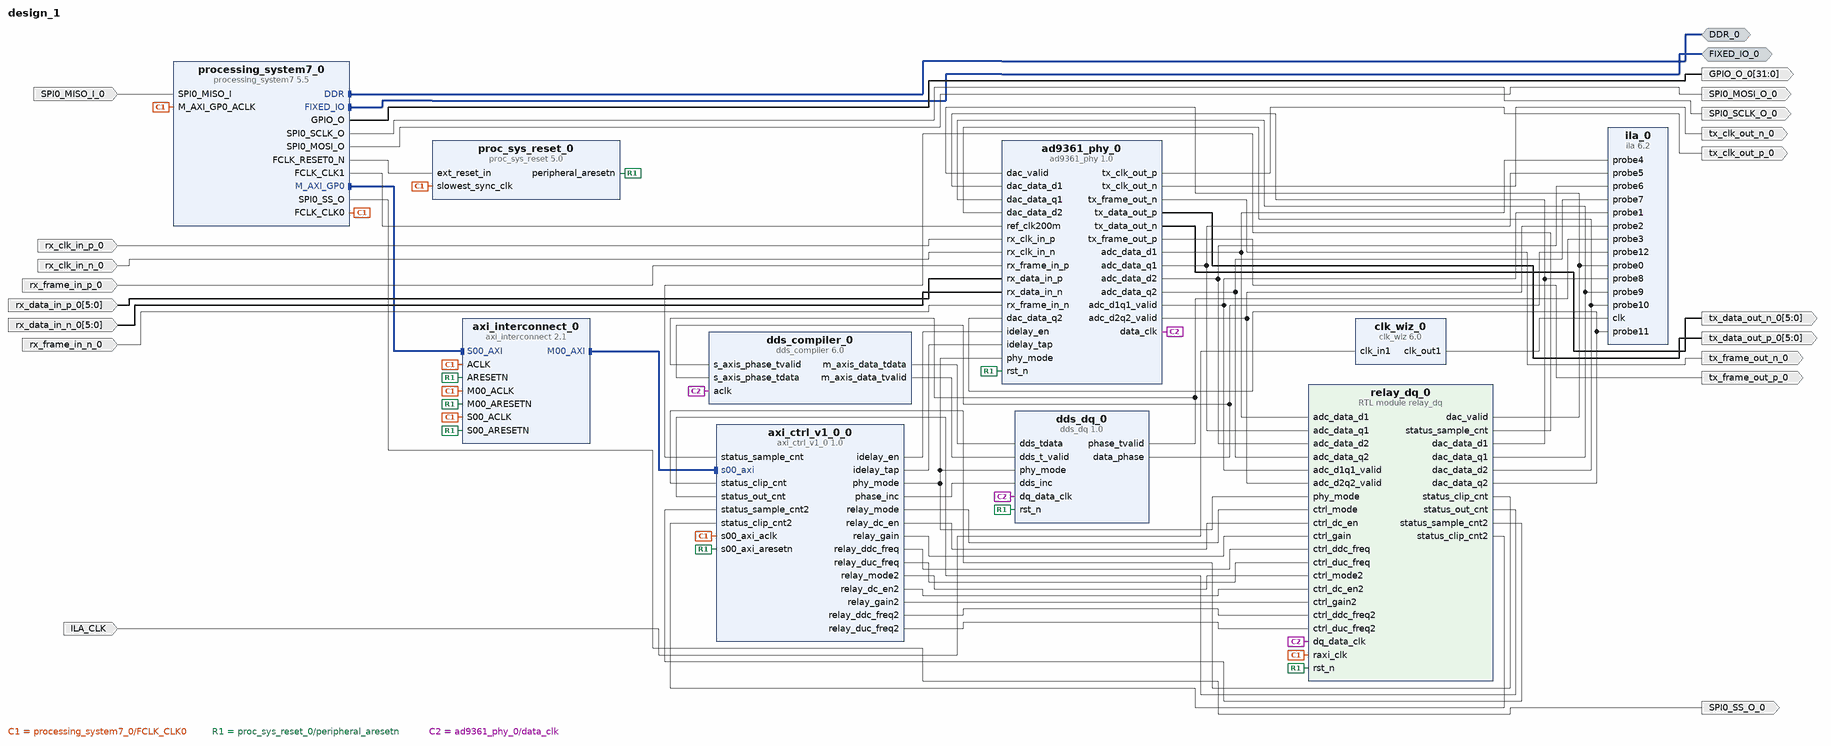
[diagram p0: block diagram of the top level]
# Vivado block design design_1, xc7z010clg400-1, Vivado 2018.3
create_bd_design design_1

create_bd_intf_port -mode Master -vlnv xilinx.com:display_processing_system7:fixedio_rtl:1.0 FIXED_IO_0
create_bd_intf_port -mode Master -vlnv xilinx.com:interface:ddrx_rtl:1.0 DDR_0
create_bd_port -dir O -from 31 -to 0 GPIO_O_0
create_bd_port -dir O SPI0_SCLK_O_0
create_bd_port -dir O SPI0_MOSI_O_0
create_bd_port -dir I SPI0_MISO_I_0
create_bd_port -dir O SPI0_SS_O_0
create_bd_port -dir I rx_clk_in_p_0
create_bd_port -dir I rx_clk_in_n_0
create_bd_port -dir I rx_frame_in_p_0
create_bd_port -dir I -from 5 -to 0 rx_data_in_p_0
create_bd_port -dir I -from 5 -to 0 rx_data_in_n_0
create_bd_port -dir I rx_frame_in_n_0
create_bd_port -dir O -from 5 -to 0 tx_data_out_p_0
create_bd_port -dir O tx_clk_out_p_0
create_bd_port -dir O tx_clk_out_n_0
create_bd_port -dir O tx_frame_out_n_0
create_bd_port -dir O -from 5 -to 0 tx_data_out_n_0
create_bd_port -dir O tx_frame_out_p_0
create_bd_port -dir I -type clk ILA_CLK
set_property -dict {CONFIG.FREQ_HZ 40000000} [get_bd_ports ILA_CLK]

create_bd_cell -type ip -vlnv xilinx.com:user:ad9361_phy:1.0 ad9361_phy_0
create_bd_cell -type ip -vlnv xilinx.com:user:axi_ctrl_v1_0:1.0 axi_ctrl_v1_0_0
create_bd_cell -type ip -vlnv xilinx.com:ip:axi_interconnect:2.1 axi_interconnect_0
set_property -dict {CONFIG.NUM_MI 1} [get_bd_cells axi_interconnect_0]
create_bd_cell -type ip -vlnv xilinx.com:ip:dds_compiler:6.0 dds_compiler_0
set_property -dict [list \
  CONFIG.DATA_Has_TLAST Not_Required \
  CONFIG.Has_Phase_Out false \
  CONFIG.Latency 6 \
  CONFIG.M_DATA_Has_TUSER Not_Required \
  CONFIG.Noise_Shaping None \
  CONFIG.Output_Frequency1 0 \
  CONFIG.Output_Width 12 \
  CONFIG.PINC1 0 \
  CONFIG.Parameter_Entry Hardware_Parameters \
  CONFIG.PartsPresent SIN_COS_LUT_only \
  CONFIG.Phase_Width 12 \
  CONFIG.S_PHASE_Has_TUSER Not_Required \
] [get_bd_cells dds_compiler_0]
create_bd_cell -type ip -vlnv xilinx.com:user:dds_dq:1.0 dds_dq_0
create_bd_cell -type ip -vlnv xilinx.com:ip:ila:6.2 ila_0
set_property -dict [list \
  CONFIG.C_ENABLE_ILA_AXI_MON false \
  CONFIG.C_MONITOR_TYPE Native \
  CONFIG.C_NUM_OF_PROBES 13 \
  CONFIG.C_PROBE10_WIDTH 12 \
  CONFIG.C_PROBE11_WIDTH 12 \
  CONFIG.C_PROBE12_WIDTH 12 \
  CONFIG.C_PROBE3_WIDTH 1 \
  CONFIG.C_PROBE4_WIDTH 12 \
  CONFIG.C_PROBE5_WIDTH 12 \
  CONFIG.C_PROBE6_WIDTH 12 \
  CONFIG.C_PROBE7_WIDTH 12 \
  CONFIG.C_PROBE8_WIDTH 12 \
  CONFIG.C_PROBE9_WIDTH 12 \
] [get_bd_cells ila_0]
create_bd_cell -type ip -vlnv xilinx.com:ip:proc_sys_reset:5.0 proc_sys_reset_0
create_bd_cell -type ip -vlnv xilinx.com:ip:processing_system7:5.5 processing_system7_0
set_property -dict [list \
  CONFIG.PCW_APU_PERIPHERAL_FREQMHZ 766 \
  CONFIG.PCW_ENET0_PERIPHERAL_ENABLE 0 \
  CONFIG.PCW_EN_CLK1_PORT 1 \
  CONFIG.PCW_FCLK_CLK1_BUF TRUE \
  CONFIG.PCW_FPGA0_PERIPHERAL_FREQMHZ 100 \
  CONFIG.PCW_FPGA1_PERIPHERAL_FREQMHZ 200 \
  CONFIG.PCW_FPGA_FCLK1_ENABLE 1 \
  CONFIG.PCW_GPIO_EMIO_GPIO_ENABLE 1 \
  CONFIG.PCW_GPIO_EMIO_GPIO_IO 32 \
  CONFIG.PCW_GPIO_EMIO_GPIO_WIDTH 32 \
  CONFIG.PCW_GPIO_MIO_GPIO_ENABLE 0 \
  CONFIG.PCW_PERIPHERAL_BOARD_PRESET None \
  CONFIG.PCW_PRESET_BANK1_VOLTAGE {LVCMOS 1.8V} \
  CONFIG.PCW_QSPI_PERIPHERAL_ENABLE 0 \
  CONFIG.PCW_SD0_GRP_CD_ENABLE 0 \
  CONFIG.PCW_SD0_GRP_WP_ENABLE 0 \
  CONFIG.PCW_SD0_PERIPHERAL_ENABLE 1 \
  CONFIG.PCW_SD0_SD0_IO {MIO 40 .. 45} \
  CONFIG.PCW_SDIO_PERIPHERAL_FREQMHZ 50 \
  CONFIG.PCW_SPI0_PERIPHERAL_ENABLE 1 \
  CONFIG.PCW_SPI0_SPI0_IO EMIO \
  CONFIG.PCW_UART1_PERIPHERAL_ENABLE 1 \
  CONFIG.PCW_UART1_UART1_IO {MIO 48 .. 49} \
  CONFIG.PCW_UART_PERIPHERAL_FREQMHZ 100 \
  CONFIG.PCW_UIPARAM_DDR_BUS_WIDTH {16 Bit} \
  CONFIG.PCW_UIPARAM_DDR_FREQ_MHZ 533.333333 \
  CONFIG.PCW_UIPARAM_DDR_PARTNO {MT41K256M16 RE-125} \
  CONFIG.PCW_USB0_PERIPHERAL_ENABLE 0 \
] [get_bd_cells processing_system7_0]
# 365 more settings of processing_system7_0 are not shown: defaults, MIO pin electricals, DDR timing, and values the tool derives
create_bd_cell -type ip -vlnv xilinx.com:ip:clk_wiz:6.0 clk_wiz_0
set_property -dict [list \
  CONFIG.CLKIN1_JITTER_PS 250.0 \
  CONFIG.CLKOUT1_DRIVES BUFG \
  CONFIG.CLKOUT1_JITTER 180.876 \
  CONFIG.CLKOUT1_PHASE_ERROR 191.950 \
  CONFIG.CLKOUT2_DRIVES BUFG \
  CONFIG.CLKOUT3_DRIVES BUFG \
  CONFIG.CLKOUT4_DRIVES BUFG \
  CONFIG.CLKOUT5_DRIVES BUFG \
  CONFIG.CLKOUT6_DRIVES BUFG \
  CONFIG.CLKOUT7_DRIVES BUFG \
  CONFIG.FEEDBACK_SOURCE FDBK_AUTO \
  CONFIG.MMCM_CLKFBOUT_MULT_F 25.000 \
  CONFIG.MMCM_CLKIN1_PERIOD 25.000 \
  CONFIG.MMCM_CLKIN2_PERIOD 10.0 \
  CONFIG.MMCM_CLKOUT0_DIVIDE_F 10.000 \
  CONFIG.MMCM_COMPENSATION ZHOLD \
  CONFIG.MMCM_DIVCLK_DIVIDE 1 \
  CONFIG.PRIMITIVE MMCM \
  CONFIG.PRIM_IN_FREQ 40 \
  CONFIG.USE_LOCKED false \
  CONFIG.USE_RESET false \
] [get_bd_cells clk_wiz_0]
create_bd_cell -type module -reference relay_dq relay_dq_0
set_property -dict {CONFIG.SNAP_PERIOD 4096} [get_bd_cells relay_dq_0]

# ---- connections ----

connect_bd_intf_net [get_bd_intf_ports DDR_0] [get_bd_intf_pins processing_system7_0/DDR]
connect_bd_intf_net [get_bd_intf_ports FIXED_IO_0] [get_bd_intf_pins processing_system7_0/FIXED_IO]
connect_bd_intf_net [get_bd_intf_pins processing_system7_0/M_AXI_GP0] [get_bd_intf_pins axi_interconnect_0/S00_AXI]
connect_bd_intf_net [get_bd_intf_pins axi_interconnect_0/M00_AXI] [get_bd_intf_pins axi_ctrl_v1_0_0/s00_axi]
connect_bd_net [get_bd_pins processing_system7_0/GPIO_O] [get_bd_ports GPIO_O_0]
connect_bd_net [get_bd_pins processing_system7_0/SPI0_SCLK_O] [get_bd_ports SPI0_SCLK_O_0]
connect_bd_net [get_bd_pins processing_system7_0/SPI0_MOSI_O] [get_bd_ports SPI0_MOSI_O_0]
connect_bd_net -net SPI0_MISO_I_0_1 [get_bd_ports SPI0_MISO_I_0] [get_bd_pins processing_system7_0/SPI0_MISO_I]
connect_bd_net [get_bd_pins processing_system7_0/SPI0_SS_O] [get_bd_ports SPI0_SS_O_0]
connect_bd_net [get_bd_pins processing_system7_0/FCLK_CLK0] \
  [get_bd_pins axi_ctrl_v1_0_0/s00_axi_aclk] [get_bd_pins axi_interconnect_0/ACLK] [get_bd_pins axi_interconnect_0/S00_ACLK] \
  [get_bd_pins axi_interconnect_0/M00_ACLK] [get_bd_pins proc_sys_reset_0/slowest_sync_clk] \
  [get_bd_pins processing_system7_0/M_AXI_GP0_ACLK] [get_bd_pins relay_dq_0/raxi_clk]
connect_bd_net [get_bd_pins processing_system7_0/FCLK_CLK1] [get_bd_pins ad9361_phy_0/ref_clk200m]
connect_bd_net -net rx_clk_in_p_0_1 [get_bd_ports rx_clk_in_p_0] [get_bd_pins ad9361_phy_0/rx_clk_in_p]
connect_bd_net -net rx_clk_in_n_0_1 [get_bd_ports rx_clk_in_n_0] [get_bd_pins ad9361_phy_0/rx_clk_in_n]
connect_bd_net -net rx_frame_in_p_0_1 [get_bd_ports rx_frame_in_p_0] [get_bd_pins ad9361_phy_0/rx_frame_in_p]
connect_bd_net -net rx_data_in_p_0_1 [get_bd_ports rx_data_in_p_0] [get_bd_pins ad9361_phy_0/rx_data_in_p]
connect_bd_net -net rx_data_in_n_0_1 [get_bd_ports rx_data_in_n_0] [get_bd_pins ad9361_phy_0/rx_data_in_n]
connect_bd_net -net rx_frame_in_n_0_1 [get_bd_ports rx_frame_in_n_0] [get_bd_pins ad9361_phy_0/rx_frame_in_n]
connect_bd_net [get_bd_pins proc_sys_reset_0/peripheral_aresetn] \
  [get_bd_pins ad9361_phy_0/rst_n] [get_bd_pins axi_ctrl_v1_0_0/s00_axi_aresetn] [get_bd_pins axi_interconnect_0/ARESETN] \
  [get_bd_pins axi_interconnect_0/S00_ARESETN] [get_bd_pins axi_interconnect_0/M00_ARESETN] [get_bd_pins dds_dq_0/rst_n] \
  [get_bd_pins relay_dq_0/rst_n]
connect_bd_net [get_bd_pins processing_system7_0/FCLK_RESET0_N] [get_bd_pins proc_sys_reset_0/ext_reset_in]
connect_bd_net [get_bd_pins dds_compiler_0/m_axis_data_tdata] [get_bd_pins dds_dq_0/dds_tdata]
connect_bd_net [get_bd_pins dds_compiler_0/m_axis_data_tvalid] [get_bd_pins dds_dq_0/dds_t_valid]
connect_bd_net [get_bd_pins dds_dq_0/phase_tvalid] [get_bd_pins dds_compiler_0/s_axis_phase_tvalid] [get_bd_pins ila_0/probe3]
connect_bd_net [get_bd_pins dds_dq_0/data_phase] [get_bd_pins dds_compiler_0/s_axis_phase_tdata] [get_bd_pins ila_0/probe12]
connect_bd_net [get_bd_pins axi_ctrl_v1_0_0/idelay_en] [get_bd_pins ad9361_phy_0/idelay_en]
connect_bd_net [get_bd_pins axi_ctrl_v1_0_0/idelay_tap] [get_bd_pins ad9361_phy_0/idelay_tap]
connect_bd_net [get_bd_pins axi_ctrl_v1_0_0/phy_mode] \
  [get_bd_pins ad9361_phy_0/phy_mode] [get_bd_pins dds_dq_0/phy_mode] [get_bd_pins relay_dq_0/phy_mode]
connect_bd_net [get_bd_pins axi_ctrl_v1_0_0/phase_inc] [get_bd_pins dds_dq_0/dds_inc]
connect_bd_net [get_bd_pins ad9361_phy_0/tx_clk_out_p] [get_bd_ports tx_clk_out_p_0]
connect_bd_net [get_bd_pins ad9361_phy_0/tx_clk_out_n] [get_bd_ports tx_clk_out_n_0]
connect_bd_net [get_bd_pins ad9361_phy_0/tx_frame_out_n] [get_bd_ports tx_frame_out_n_0]
connect_bd_net [get_bd_pins ad9361_phy_0/tx_data_out_p] [get_bd_ports tx_data_out_p_0]
connect_bd_net [get_bd_pins ad9361_phy_0/tx_data_out_n] [get_bd_ports tx_data_out_n_0]
connect_bd_net [get_bd_pins ad9361_phy_0/adc_data_d1] [get_bd_pins ila_0/probe4] [get_bd_pins relay_dq_0/adc_data_d1]
connect_bd_net [get_bd_pins ad9361_phy_0/adc_data_q1] [get_bd_pins ila_0/probe5] [get_bd_pins relay_dq_0/adc_data_q1]
connect_bd_net [get_bd_pins ad9361_phy_0/adc_data_d2] [get_bd_pins ila_0/probe6] [get_bd_pins relay_dq_0/adc_data_d2]
connect_bd_net [get_bd_pins ad9361_phy_0/adc_data_q2] [get_bd_pins ila_0/probe7] [get_bd_pins relay_dq_0/adc_data_q2]
connect_bd_net [get_bd_pins ad9361_phy_0/tx_frame_out_p] [get_bd_ports tx_frame_out_p_0]
connect_bd_net [get_bd_pins ad9361_phy_0/adc_d1q1_valid] [get_bd_pins ila_0/probe1] [get_bd_pins relay_dq_0/adc_d1q1_valid]
connect_bd_net [get_bd_pins ad9361_phy_0/adc_d2q2_valid] [get_bd_pins ila_0/probe2] [get_bd_pins relay_dq_0/adc_d2q2_valid]
connect_bd_net [get_bd_pins ad9361_phy_0/data_clk] \
  [get_bd_pins dds_dq_0/dq_data_clk] [get_bd_pins dds_compiler_0/aclk] [get_bd_pins relay_dq_0/dq_data_clk]
connect_bd_net [get_bd_ports ILA_CLK] [get_bd_pins clk_wiz_0/clk_in1]
connect_bd_net [get_bd_pins clk_wiz_0/clk_out1] [get_bd_pins ila_0/clk]
connect_bd_net [get_bd_pins relay_dq_0/status_sample_cnt] [get_bd_pins axi_ctrl_v1_0_0/status_sample_cnt]
connect_bd_net [get_bd_pins relay_dq_0/status_clip_cnt] [get_bd_pins axi_ctrl_v1_0_0/status_clip_cnt]
connect_bd_net [get_bd_pins relay_dq_0/status_out_cnt] [get_bd_pins axi_ctrl_v1_0_0/status_out_cnt]
connect_bd_net [get_bd_pins axi_ctrl_v1_0_0/relay_mode] [get_bd_pins relay_dq_0/ctrl_mode]
connect_bd_net [get_bd_pins axi_ctrl_v1_0_0/relay_dc_en] [get_bd_pins relay_dq_0/ctrl_dc_en]
connect_bd_net [get_bd_pins axi_ctrl_v1_0_0/relay_gain] [get_bd_pins relay_dq_0/ctrl_gain]
connect_bd_net [get_bd_pins axi_ctrl_v1_0_0/relay_ddc_freq] [get_bd_pins relay_dq_0/ctrl_ddc_freq]
connect_bd_net [get_bd_pins axi_ctrl_v1_0_0/relay_duc_freq] [get_bd_pins relay_dq_0/ctrl_duc_freq]
connect_bd_net [get_bd_pins axi_ctrl_v1_0_0/relay_mode2] [get_bd_pins relay_dq_0/ctrl_mode2]
connect_bd_net [get_bd_pins axi_ctrl_v1_0_0/relay_dc_en2] [get_bd_pins relay_dq_0/ctrl_dc_en2]
connect_bd_net [get_bd_pins axi_ctrl_v1_0_0/relay_gain2] [get_bd_pins relay_dq_0/ctrl_gain2]
connect_bd_net [get_bd_pins axi_ctrl_v1_0_0/relay_ddc_freq2] [get_bd_pins relay_dq_0/ctrl_ddc_freq2]
connect_bd_net [get_bd_pins axi_ctrl_v1_0_0/relay_duc_freq2] [get_bd_pins relay_dq_0/ctrl_duc_freq2]
connect_bd_net [get_bd_pins relay_dq_0/status_sample_cnt2] [get_bd_pins axi_ctrl_v1_0_0/status_sample_cnt2]
connect_bd_net [get_bd_pins relay_dq_0/status_clip_cnt2] [get_bd_pins axi_ctrl_v1_0_0/status_clip_cnt2]
connect_bd_net [get_bd_pins relay_dq_0/dac_valid] [get_bd_pins ad9361_phy_0/dac_valid] [get_bd_pins ila_0/probe0]
connect_bd_net [get_bd_pins relay_dq_0/dac_data_d1] [get_bd_pins ad9361_phy_0/dac_data_d1] [get_bd_pins ila_0/probe8]
connect_bd_net [get_bd_pins relay_dq_0/dac_data_q1] [get_bd_pins ad9361_phy_0/dac_data_q1] [get_bd_pins ila_0/probe9]
connect_bd_net [get_bd_pins relay_dq_0/dac_data_d2] [get_bd_pins ad9361_phy_0/dac_data_d2] [get_bd_pins ila_0/probe10]
connect_bd_net [get_bd_pins relay_dq_0/dac_data_q2] [get_bd_pins ad9361_phy_0/dac_data_q2] [get_bd_pins ila_0/probe11]

# ---- address map ----
assign_bd_address -offset 0x43C00000 -range 64K -target_address_space [get_bd_addr_spaces processing_system7_0/Data] [get_bd_addr_segs axi_ctrl_v1_0_0/s00_axi/reg0]

validate_bd_design
save_bd_design
